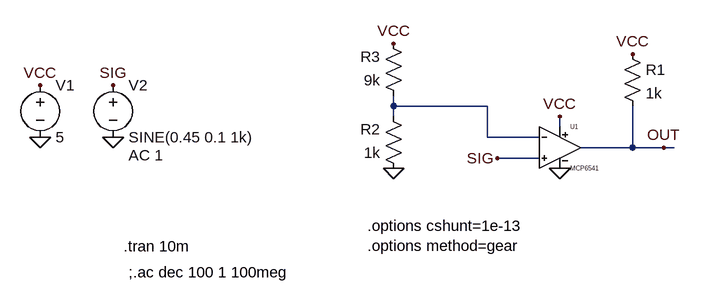
[diagram p0: schematic mcp6541.asc]
mcp6541.asc, the LTspice schematic file:
Version 4
SHEET 1 880 680
WIRE -32 112 -32 96
WIRE 112 112 -32 112
WIRE -32 128 -32 112
WIRE 224 144 224 128
WIRE 112 160 112 112
WIRE 192 160 112 160
WIRE 336 176 336 112
WIRE 336 176 256 176
WIRE 384 176 336 176
WIRE 400 176 384 176
WIRE 192 192 128 192
FLAG -576 160 0
FLAG -576 80 VCC
FLAG 224 128 VCC
FLAG -464 160 0
FLAG -464 80 SIG
FLAG 384 176 OUT
FLAG 128 192 SIG
FLAG 224 208 0
FLAG -32 208 0
FLAG 336 32 VCC
FLAG -32 16 VCC
SYMBOL voltage -576 64 R0
WINDOW 123 0 0 Left 0
WINDOW 39 0 0 Left 0
SYMATTR InstName V1
SYMATTR Value 5
SYMBOL voltage -464 64 R0
WINDOW 123 24 124 Left 2
WINDOW 39 0 0 Left 0
SYMATTR Value2 AC 1
SYMATTR InstName V2
SYMATTR Value SINE(0.45 0.1 1k)
SYMBOL res -16 224 R180
WINDOW 0 36 76 Left 2
WINDOW 3 36 40 Left 2
SYMATTR InstName R2
SYMATTR Value 1k
SYMBOL res -16 112 R180
WINDOW 0 36 76 Left 2
WINDOW 3 36 40 Left 2
SYMATTR InstName R3
SYMATTR Value 9k
SYMBOL MCP6541 224 112 R0
SYMATTR InstName U1
SYMBOL res 320 16 R0
SYMATTR InstName R1
SYMATTR Value 1k
TEXT -448 328 Left 2 !.tran 10m
TEXT -440 368 Left 2 !;.ac dec 100 1 100meg
TEXT -72 296 Left 2 !.options cshunt=1e-13\n.options method=gear

The netlist it stands for:
* mcp6541.asc
V1 VCC 0 5
V2 SIG 0 SINE(0.45 0.1 1k) AC 1
R2 0 N001 1k
R3 N001 VCC 9k
XU1 SIG N001 VCC 0 OUT MCP6541  ; pins IN+ IN- VCC VEE OUT
R1 VCC OUT 1k
.tran 10m
;.ac dec 100 1 100meg
.options cshunt=1e-13
.options method=gear
.lib MCP6541.lib
.backanno
.end